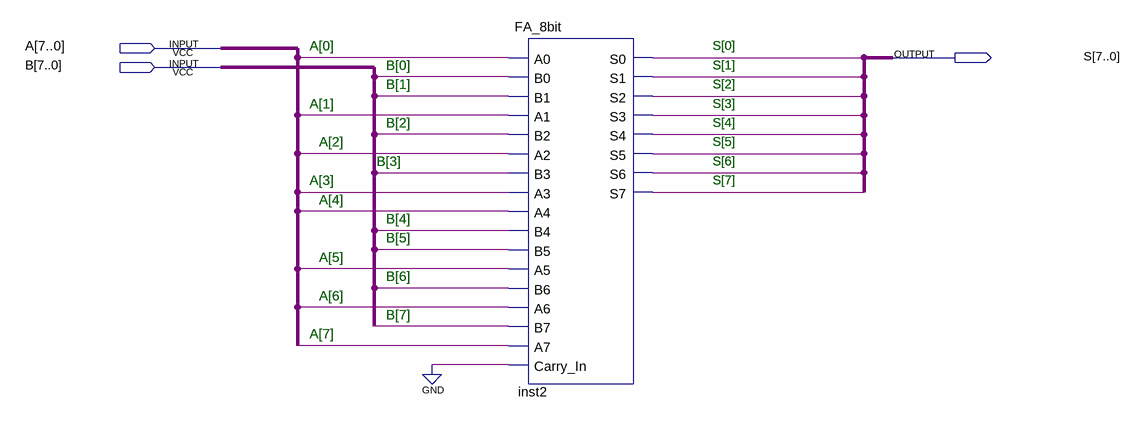
[diagram p0: schematic sheet]
// Quartus schematic Adder_8bit.bdf as structural Verilog: 1 symbols, 3 pins
module Adder_8bit (
  input  [7:0] A,
  input  [7:0] B,
  output [7:0] S
);

  FA_8bit inst2 (
    .A0(A[0]), .B0(B[0]), .B1(B[1]), .A1(A[1]), .B2(B[2]), .A2(A[2]), .B3(B[3]), .A3(A[3]), .A4(A[4]),
    .B4(B[4]), .B5(B[5]), .A5(A[5]), .B6(B[6]), .A6(A[6]), .B7(B[7]), .A7(A[7]), .Carry_In(1'b0), .S0(S[0]),
    .S1(S[1]), .S2(S[2]), .S3(S[3]), .S4(S[4]), .S5(S[5]), .S6(S[6]), .S7(S[7]));

  // Notes on the sheet:
  //   A[0]
  //   S[0]
  //   B[0]
  //   S[1]
  //   B[1]
  //   S[2]
  //   A[1]
  //   S[3]
  //   B[2]
  //   S[4]
  //   A[2]
  //   S[5]
  //   B[3]
  //   S[6]
  //   A[3]
  //   S[7]
  //   A[4]
  //   B[4]
  //   B[5]
  //   A[5]
  //   B[6]
  //   A[6]
  //   B[7]
  //   A[7]
endmodule
